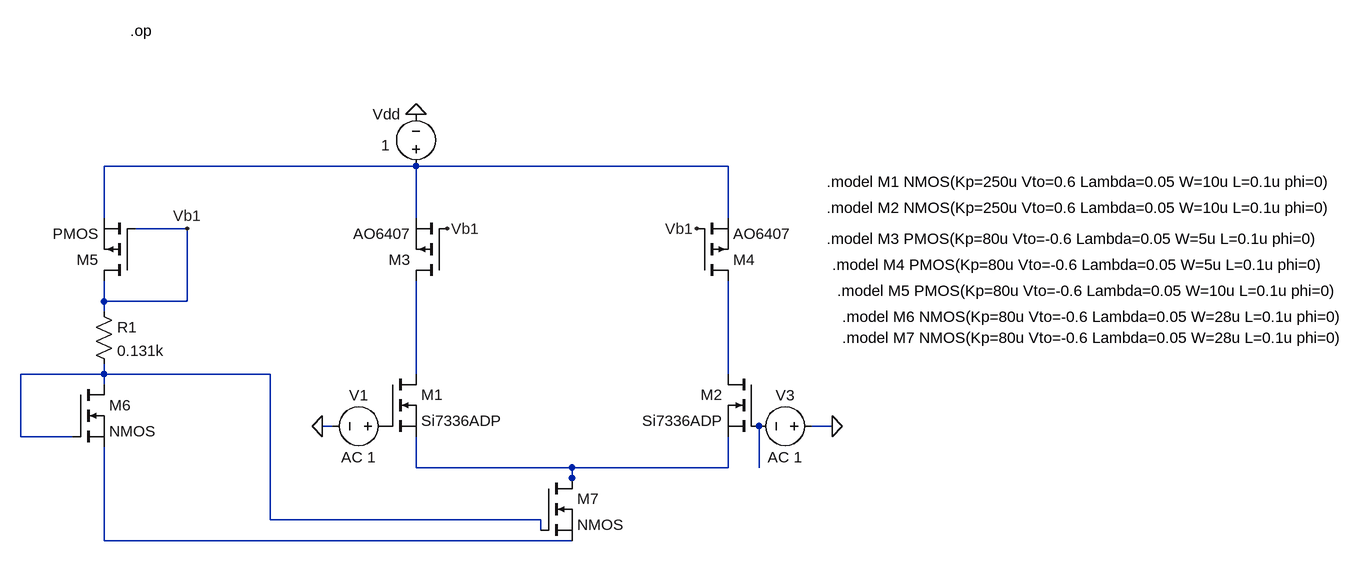
[diagram p0: schematic 4.asc]
4.asc, the LTspice schematic file:
Version 4
SHEET 1 1748 776
WIRE 240 -144 -240 -144
WIRE 720 -144 240 -144
WIRE -240 -64 -240 -144
WIRE 240 -64 240 -144
WIRE 720 -64 720 -144
WIRE -112 -48 -192 -48
WIRE -240 64 -240 32
WIRE -112 64 -112 -48
WIRE -112 64 -240 64
WIRE -240 80 -240 64
WIRE -240 176 -240 160
WIRE -240 176 -368 176
WIRE 16 176 -240 176
WIRE 240 176 240 32
WIRE 720 176 720 32
WIRE -240 192 -240 176
WIRE 112 256 96 256
WIRE 880 256 848 256
WIRE -368 272 -368 176
WIRE -288 272 -368 272
WIRE 240 320 240 272
WIRE 480 320 240 320
WIRE 720 320 720 272
WIRE 720 320 480 320
WIRE 768 320 768 256
WIRE 480 336 480 320
WIRE 480 352 480 336
WIRE 16 400 16 176
WIRE 432 400 16 400
WIRE 432 416 432 400
WIRE -240 432 -240 288
WIRE 480 432 -240 432
FLAG 288 -48 Vb1
FLAG 672 -48 Vb1
FLAG 880 256 0
FLAG -112 -48 Vb1
FLAG 240 -224 0
FLAG 96 256 0
SYMBOL nmos 192 176 R0
SYMATTR InstName M1
SYMATTR Value Si7336ADP
SYMBOL nmos 768 176 M0
SYMATTR InstName M2
SYMATTR Value Si7336ADP
SYMBOL pmos 288 32 R180
SYMATTR InstName M3
SYMATTR Value AO6407
SYMBOL pmos 672 32 M180
SYMATTR InstName M4
SYMATTR Value AO6407
SYMBOL pmos -192 32 R180
SYMATTR InstName M5
SYMBOL voltage 240 -128 R180
WINDOW 0 24 96 Left 2
WINDOW 3 40 48 Left 2
WINDOW 123 0 0 Left 0
WINDOW 39 0 0 Left 0
SYMATTR InstName Vdd
SYMATTR Value 1
SYMBOL voltage 208 256 R90
WINDOW 0 -32 56 VBottom 2
WINDOW 3 32 56 VTop 2
WINDOW 123 0 0 Left 0
WINDOW 39 0 0 Left 0
SYMATTR InstName V1
SYMATTR Value AC 1
SYMBOL voltage 864 256 R90
WINDOW 0 -32 56 VBottom 2
WINDOW 3 32 56 VTop 2
SYMATTR InstName V3
SYMATTR Value AC 1
SYMBOL res -256 64 R0
SYMATTR InstName R1
SYMATTR Value 0.131k
SYMBOL nmos -288 192 R0
SYMATTR InstName M6
SYMBOL nmos 432 336 R0
SYMATTR InstName M7
TEXT 872 -120 Left 2 !.model M1 NMOS(Kp=250u Vto=0.6 Lambda=0.05 W=10u L=0.1u phi=0)
TEXT 872 -80 Left 2 !.model M2 NMOS(Kp=250u Vto=0.6 Lambda=0.05 W=10u L=0.1u phi=0)
TEXT 872 -32 Left 2 !.model M3 PMOS(Kp=80u Vto=-0.6 Lambda=0.05 W=5u L=0.1u phi=0)
TEXT 880 8 Left 2 !.model M4 PMOS(Kp=80u Vto=-0.6 Lambda=0.05 W=5u L=0.1u phi=0)
TEXT -200 -352 Left 2 !.op
TEXT 888 48 Left 2 !.model M5 PMOS(Kp=80u Vto=-0.6 Lambda=0.05 W=10u L=0.1u phi=0)
TEXT 896 88 Left 2 !.model M6 NMOS(Kp=80u Vto=-0.6 Lambda=0.05 W=28u L=0.1u phi=0)
TEXT 896 120 Left 2 !.model M7 NMOS(Kp=80u Vto=-0.6 Lambda=0.05 W=28u L=0.1u phi=0)

The netlist it stands for:
* 4.asc
M1 N003 P001 N005 N005 Si7336ADP
M2 N004 N006 N005 N005 Si7336ADP
M3 N003 Vb1 N001 N001 AO6407
M4 N004 Vb1 N001 N001 AO6407
M5 Vb1 Vb1 N001 N001 PMOS
Vdd N001 0 1
V1 P001 0 AC 1
V3 0 N006 AC 1
R1 Vb1 N002 0.131k
M6 N002 N002 N007 N007 NMOS
M7 N005 N002 N007 N007 NMOS
.model NMOS NMOS
.model PMOS PMOS
.lib standard.mos
.model M1 NMOS(Kp=250u Vto=0.6 Lambda=0.05 W=10u L=0.1u phi=0)
.model M2 NMOS(Kp=250u Vto=0.6 Lambda=0.05 W=10u L=0.1u phi=0)
.model M3 PMOS(Kp=80u Vto=-0.6 Lambda=0.05 W=5u L=0.1u phi=0)
.model M4 PMOS(Kp=80u Vto=-0.6 Lambda=0.05 W=5u L=0.1u phi=0)
.op
.model M5 PMOS(Kp=80u Vto=-0.6 Lambda=0.05 W=10u L=0.1u phi=0)
.model M6 NMOS(Kp=80u Vto=-0.6 Lambda=0.05 W=28u L=0.1u phi=0)
.model M7 NMOS(Kp=80u Vto=-0.6 Lambda=0.05 W=28u L=0.1u phi=0)
.backanno
.end